# Altium project MelansonTech Isolated Current Sense Rev 2.PrjPcb
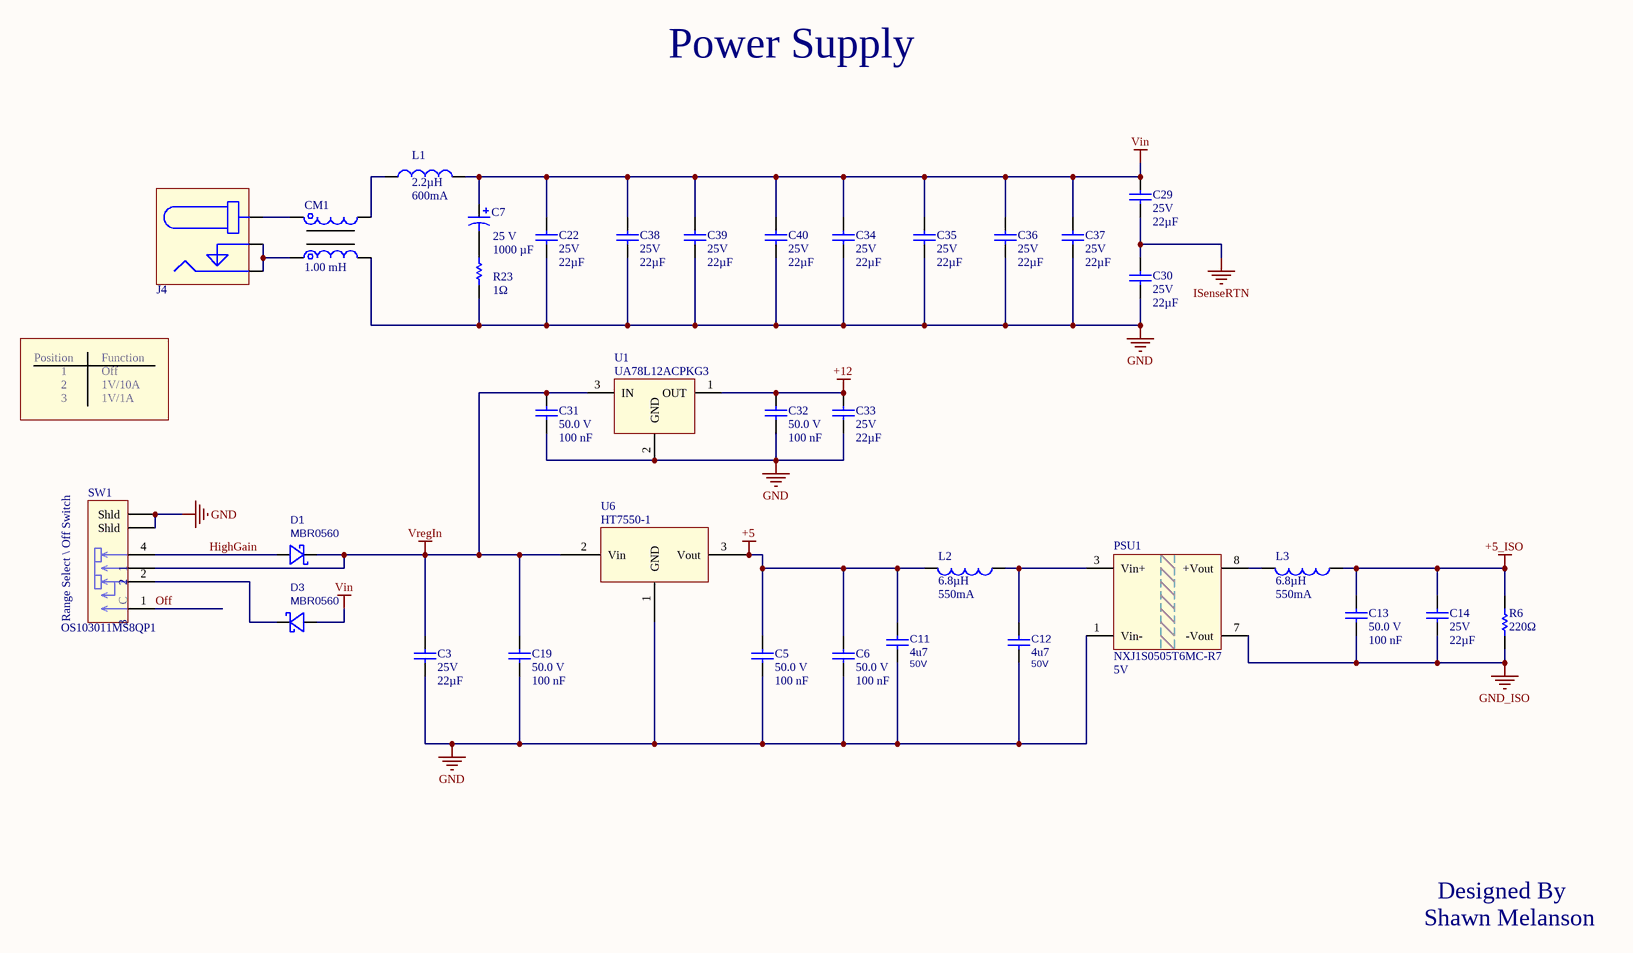
[diagram p0: MelansonTech PSU_IsolatedShuntAmp Rev2.SchDoc]
2 sheets, 95 parts. Net scope: global (net labels, ports and power ports of the same name join across sheets).
Sheets:
  MelansonTech PSU_IsolatedShuntAmp Rev2.SchDoc
  MelansonTech Isolated Shunt Amplifier rev 2 alt shunt.SchDoc

## Sheet MelansonTech PSU_IsolatedShuntAmp Rev2.SchDoc
size B

### Parts
C3  Voltage - Rated: 25V  Capacitance: 22µF  [Cap,0805]  (hidden comment: CL21A226MAQNNNE)
C5  Voltage Rating (DC): 50.0 V  Capacitance: 100 nF  [CAP, 0805, HD]  (hidden comment: CC0805KRX7R9BB104)
C6  Voltage Rating (DC): 50.0 V  Capacitance: 100 nF  [CAP, 0805, HD]  (hidden comment: CC0805KRX7R9BB104)
C7  Capacitance: 1000 µF  Voltage - Rated: 25 V  [Cap,5mm Lead Spaceing,14mm HIGH,10MM Dia, Polymer - RA1]  (hidden comment: A750MV108M1EAAE014)
C11  Capacitance: 4u7  Voltage: 50V  [Cap, 1206]  (hidden comment: CL31B475KBHNNNE)
C12  Capacitance: 4u7  Voltage: 50V  [Cap, 1206]  (hidden comment: CL31B475KBHNNNE)
C13  Voltage Rating (DC): 50.0 V  Capacitance: 100 nF  [Cap,0805]  (hidden comment: CC0805KRX7R9BB104)
C14  Voltage - Rated: 25V  Capacitance: 22µF  [Cap,0805]  (hidden comment: CL21A226MAQNNNE)
C19  Voltage Rating (DC): 50.0 V  Capacitance: 100 nF  [CAP, 0805, HD]  (hidden comment: CC0805KRX7R9BB104)
C22  Voltage - Rated: 25V  Capacitance: 22µF  [Cap,0805]  (hidden comment: CL21A226MAQNNNE)
C29  Voltage - Rated: 25V  Capacitance: 22µF  [Cap,0805]  (hidden comment: CL21A226MAQNNNE)
C30  Voltage - Rated: 25V  Capacitance: 22µF  [Cap,0805]  (hidden comment: CL21A226MAQNNNE)
C31  Voltage Rating (DC): 50.0 V  Capacitance: 100 nF  [CAP, 0805, HD]  (hidden comment: CC0805KRX7R9BB104)
C32  Voltage Rating (DC): 50.0 V  Capacitance: 100 nF  [CAP, 0805, HD]  (hidden comment: CC0805KRX7R9BB104)
C33  Voltage - Rated: 25V  Capacitance: 22µF  [Cap,0805]  (hidden comment: CL21A226MAQNNNE)
C34  Voltage - Rated: 25V  Capacitance: 22µF  [Cap,0805]  (hidden comment: CL21A226MAQNNNE)
C35  Voltage - Rated: 25V  Capacitance: 22µF  [Cap,0805]  (hidden comment: CL21A226MAQNNNE)
C36  Voltage - Rated: 25V  Capacitance: 22µF  [Cap,0805]  (hidden comment: CL21A226MAQNNNE)
C37  Voltage - Rated: 25V  Capacitance: 22µF  [Cap,0805]  (hidden comment: CL21A226MAQNNNE)
C38  Voltage - Rated: 25V  Capacitance: 22µF  [Cap,0805]  (hidden comment: CL21A226MAQNNNE)
C39  Voltage - Rated: 25V  Capacitance: 22µF  [Cap,0805]  (hidden comment: CL21A226MAQNNNE)
C40  Voltage - Rated: 25V  Capacitance: 22µF  [Cap,0805]  (hidden comment: CL21A226MAQNNNE)
CM1  Inductance: 1.00 mH  [CM Choke,SMD, DR331]  (hidden comment: DR331-105BE)
D1  MBR0560  [SOD123]
D3  MBR0560  [SOD123]
J4  PJ-002A  [Connector,Barrel,2.1mm,5.5mm,DC power Jack]  (value not drawn)
L1  Inductance: 2.2µH  Current Rating: 600mA  [Ind, 0805]  (hidden comment: MLZ2012M2R2HT000)
L2  Inductance: 6.8µH  Current Rating (Amps): 550mA  [Ind, 0805]  (hidden comment: MLZ2012N6R8LT000)
L3  Inductance: 6.8µH  Current Rating (Amps): 550mA  [Ind, 0805]  (hidden comment: MLZ2012N6R8LT000)
PSU1  Voltage - Output 1: 5V  [14-SMD Module, 6 Leads,NXJ1S0505T6MC-R7]  (hidden comment: NXJ1S0505T6MC-R7)
R6  Resistance: 220Ω  [Res,1206]  (hidden comment: RMCF1206FT220R)
R23  Resistance: 1Ω  [res, 0805, HD]  (hidden comment: Res1)
SW1  OS103011MS8QP1  [Switch,Slide,.SP3T, OS103011 -Side]
U1  UA78L12ACPKG3  [SOT89-3]
U6  HT7550-1  [SOT89-3]

### Nets
+5: C5.2 C6.2 C11.2 L2.2 U6.3(Vout)
+5_ISO: C13.2 C14.2 L3.1 R6.2
+12: C32.2 C33.2 U1.1(OUT)
GND: C3.1 C5.1 C6.1 C11.1 C12.1 C19.1 C22.1 C30.1 C31.1 C32.1 C33.1 C34.1 C35.1 C36.1 C37.1 C38.1 C39.1 C40.1 CM1.4 PSU1.1(Vin-) R23.1 SW1.5(Shld) SW1.6(Shld) U1.2(GND) U6.1(GND)
GND_ISO: C13.1 C14.1 PSU1.7(-Vout) R6.1
ISenseRTN: C29.1 C30.2
Vin: C7.1 C22.2 C29.2 C34.2 C35.2 C36.2 C37.2 C38.2 C39.2 C40.2 D3.2(A) L1.2
VregIn: C3.2 C19.2 C31.2 D1.1(C) SW1.3 U1.3(IN) U6.2(Vin)
HighGain: D1.2(A) SW1.4
Off: SW1.1
NetC7_2: C7.2 R23.2
NetC12_2: C12.2 L2.1 PSU1.3(Vin+)
NetCM1_1: CM1.1 J4.1
NetCM1_2: CM1.2 L1.1
NetCM1_3: CM1.3 J4.2 J4.3
NetD3_1: D3.1(C) SW1.2
NetL3_2: L3.2 PSU1.8(+Vout)

Not connected (* = marked no-connect by the designer): PSU1 12(NC) 14(NC)

### Notes on the sheet
- Power Supply
- Position
- 1
- 2
- Function
- Off
- 1V/10A
- 3
- 1V/1A
- Range Select \ Off Switch
- Shawn Melanson
- Designed By
- (in symbol Switch,TH,Slide,SP3T,100MA,12V,OS103011MS8QP1) C

### Library data of the parts
C3 C14 C22 C29 C30 C33-C40 = Cap,0805,22uF,25V,X5R,±20%,CL21A226MAQNNNE: CAP CER 22UF 25V X5R 0805; Manufacturer: Samsung Electro-Mechanics; Detailed Description: 22 µF ±20% 6.3V Ceramic Capacitor X5R 0805 (2012 Metric); Tolerance: ±20%; mfg P/N: CL21A226MAQNNNE; Category: Capacitors  Ceramic Capacitors; Series: CL; Part Status: Active; Temperature Coefficient: X5R; Operating Temperature: -55°C ~ 85°C; Applications: General Purpose; Mounting Type: Surface Mount, MLCC; Package / Case: 0805 (2012 Metric); Size / Dimension: 0.079" L x 0.049" W (2.00mm x 1.25mm); Thickness (Max): 0.055" (1.40mm); Supplier 1: Mouser; Supplier Part Number 1: 187-CL31B226KPHNNNE; Supplier 2: Digikey; Supplier Part Number 2: 1276-2769-6-ND; Supplier 3: Digikey; Supplier Part Number 3: 1276-2769-1-ND
C5 C6 C13 C19 C31 C32 = Cap,0805,100nf,50V,5%,CC0805KRX7R9BB104: CAP CER 0.1UF 50V X7R 0805; Manufacturer: YAGEO; Capacitance Tolerance: ±10%; Detailed Description: 0.1 µF ±10% 50V Ceramic Capacitor X7R 0805 (2012 Metric); Supplier 1: Digikey; Supplier Part Number 1: 311-1140-6-ND; Supplier 2: Digikey; Supplier Part Number 2: 311-1140-1-ND; Supplier 3: Mouser; Supplier Part Number 3: 603-CC805KRX7R9BB104; Supplier 4: Arrow Electronics; Supplier Part Number 4: CC0805KRX7R9BB104; Supplier 5: Digikey; Supplier Part Number 5: 311-1140-2-ND; Supplier 6: Future Electronics; Supplier Part Number 6: 2986263; Manufacturer Product Number: CC0805KRX7R9BB104; Category: Capacitors  Ceramic Capacitors; Series: CC; Part Status: Active; Temperature Coefficient: X7R; Operating Temperature: -55°C ~ 125°C; Applications: General Purpose; Mounting Type: Surface Mount, MLCC; Package / Case: 0805 (2012 Metric); Size / Dimension: 0.079" L x 0.049" W (2.00mm x 1.25mm); Thickness (Max): 0.033" (0.85mm)
C7 = Cap,Polar,TH,1000uF,25V,Polymer,±20%,A750MV108M1EAAE014: 1000 µF 25 V Aluminum - Polymer Capacitors Radial, Can 14mOhm 2000 Hrs @ 105°C; Manufacturer: KEMET; Tolerance: ±20%; Ripple Current @ Low Frequency: 255 mA @ 120 Hz; Ripple Current @ High Frequency: 5.1 A @ 100 kHz; Base Product Number: A750MV; mfg P/N: A750MV108M1EAAE014; Detailed Description: 1000 µF 25 V Aluminum - Polymer Capacitors Radial, Can 14mOhm 2000 Hrs @ 105°C; Category: Capacitors  Aluminum - Polymer Capacitors; Series: A750; Part Status: Active; Type: Polymer; ESR (Equivalent Series Resistance): 14mOhm; Lifetime @ Temp.: 2000 Hrs @ 105°C; Operating Temperature: -55°C ~ 105°C; Applications: General Purpose; Lead Spacing: 0.197" (5.00mm); Size / Dimension: 0.394" Dia (10.00mm); Height - Seated (Max): 0.630" (16.00mm); Mounting Type: Through Hole; Package / Case: Radial, Can; Supplier 1: Digi-Key; Supplier Part Number 1: 399-A750MV108M1EAAE014-ND; Supplier 2: Mouser; Supplier Part Number 2: 80-A750MV108M1EAAE14
C11 C12 = Cap,1206,4.7uF,10%,50V,CL31B475KBHNNNE: Cap,SMD,MLCC,4u7,50V,X7R,10%,1206; Manufacturer: Samsung; Manufacturer P/N: CL31B475KBHNNNE; Tolerance: 10%; Package: 1206; Supplier 1: LCSC; Supplier Part Number 1: C51205; Supplier 2: Digi-Key; Supplier Part Number 2: 1276-2789-1-ND; JLCPCB Part #: C29823
CM1 = common mode, 1mH@100kHz, 500mA, SMD,2ln, DR331-105BE: CMC 1MH 500MA 2LN SMD; Lead-Free Status: Lead Free; Detailed Description: 1 mH @ 100 kHz 2 Line Common Mode Choke Surface Mount 500mA DCR 400mOhm; Category  Filters: Common Mode Chokes; Filter Type: Signal Line; Number of Lines: 2; DC Resistance (DCR) (Max): 400mOhm; Voltage Rating - DC: 80V; Voltage Rating - AC: 42V; Base Product Number: DR331; mfg P/N: DR331-105BE; Mounting Style: SMD; Current Rating: 500mA; Series: DR331; Part Status: Active; Inductance @ Frequency: 1 mH @ 100 kHz; Operating Temperature: -40°C ~ 135°C; Mounting Type: Surface Mount; Size / Dimension: 0.287" L x 0.213" W (7.30mm x 5.40mm); Height (Max): 0.197" (5.00mm); Package / Case: Horizontal, 4 Flat Lead
D1 D3 = Diode,SOD123,Shottky,60V,0.5A,MBR0560: Dio,Sig,Schtky,0.5A,60V,SOD123; Manufacturer: MCC; mfg P/N: MBR0560-TP; Details: 700mV @ 500mA, 200µA @ 60V,30pF @ 4V, 1MHz; Not Stuffed: N/S; Fast Supplier: Digi-Key; Current: 0.5A; Package: SOD123; Voltage: 60V; Supplier 1: Digi-Key; Supplier Part Number 1: MBR0560TPMSCT-ND; Supplier 2: LCSC; Supplier Part Number 2: C150515; JLCPCB Part #: C77338
J4 = Connector,Barrel,ID 2.1mm,OD 5.5mm,Power Connect, PJ-002A: Power Barrel Connector Jack 2.10mm ID (0.083"), 5.50mm OD (0.217") Through Hole, Right Angle; Manufacturer: CUI Inc.; Actual Diameter: 0.079" (2.00mm ID), 0.256" (6.50mm OD); Number of Positions/Contacts: 2 Conductors, 3 Contacts; Mating Length/Depth: 0.354" (9.00mm); Dielectric Material: Polybutylene Terephthalate (PBT); Internal Switch(s): Does Not Contain Switch; Shielding: Unshielded; Voltage - Rated: 24VDC; Current Rating (Amps): 2.5A; Material Flammability Rating: UL94 V-0; Body Color: Black; mfg P\N: PJ-002A; Industry Recognized Mating Diameter: 2.10mm ID (0.083"), 5.50mm OD (0.217"); Connector Type: Jack; Mounting Type: Through Hole, Right Angle; Termination: Solder Eyelet(s); Contact Material - Plating: Tin; Operating Temperature: -25°C ~ 85°C; Contact Material: Brass, Copper Alloy; Supplier 1: Digi-Key; Supplier Part Number 1: CP-002A-ND
L1 = Ind. 0805,2.2uH,600mA,160mOhm, MLZ2012M2R2HT000: FIXED IND 2.2UH 600MA 160 MOHM; Manufacturer: TDK Corporation; Detailed Description: 2.2µH Shielded Multilayer Inductor 600mA 208 mOhm Max 0805 (2012 Metric); Type: Multilayer; Material - Core: Ferrite; Tolerance: ±20%; Current - Saturation: 400mA; Shielding: Shielded; DC Resistance (DCR): 208 mOhm Max; Frequency - Self Resonant: 100MHz; Inductance Frequency - Test: 2MHz; mfg P/N: MLZ2012M2R2HT000; Series: MLZ; Operating Temperature: -55°C ~ 125°C; Mounting Type: Surface Mount; Package / Case: 0805 (2012 Metric); Supplier 1: Digi-Key; Supplier Part Number 1: 445-8658-1-ND
L2 L3 = Ind,0805,6.8uH,550mA,0.25Ω, MLZ2012N6R8LT000: FIXED IND 6.8UH 550MA 250 MOHM; Manufacturer: TDK Corporation; Detailed Description: 6.8µH Shielded Multilayer Inductor 550mA 250mOhm 0805 (2012 Metric); Type: Multilayer; Material - Core: Ferrite; Tolerance: ±20%; Current - Saturation: 110mA; Shielding: Shielded; Frequency - Self Resonant: 60MHz; Inductance Frequency - Test: 2MHz; mfg P/N: MLZ2012N6R8LT000; Category: Inductors, Coils, Chokes  Fixed Inductors; Series: MLZ; Part Status: Active; DC Resistance (DCR): 250mOhm; Operating Temperature: -55°C ~ 125°C; Mounting Type: Surface Mount; Package / Case: 0805 (2012 Metric); Supplier Device Package: 0805 (2012 Metric); Size / Dimension: 0.079"" L x 0.049"" W (2.00mm x 1.25mm); Height - Seated (Max): 0.041"" (1.05mm); Supplier 1: Digi-Key; Supplier Part Number 1: 445-6761-1-ND; Supplier 2: LCSC; Supplier Part Number 2: C82157
PSU1 = Mod,PSU,Isolated,4.5-5Vin,5Vout,1W,4.2kVIso,200mA,NXJ1S0505T6MC-R7: Isolated Module DC DC Converter 1 Output 5V 200mA 4.5V - 5.5V Input; Manufacturer: Murata Power Solutions Inc.; Number of Outputs: 1; Power (Watts): 1 W; Voltage - Isolation: 4.2 kV; Efficiency: 76%; Approval Agency: cURus; Standard Number: 60601-1; 62368-1; Detailed Description: Isolated Module DC DC Converter 1 Output 5V 200mA 4.5V - 5.5V Input; Category: Power Supplies - Board Mount  DC DC Converters; Series: NXJ1T (1W); Part Status: Active; Type: Isolated Module; Voltage - Input (Min): 4.5V; Voltage - Input (Max): 5.5V; Current - Output (Max): 200mA; Applications: ITE (Commercial), Medical; Operating Temperature: -40°C ~ 125°C (With Derating); Mounting Type: Surface Mount; Package / Case: 14-SMD Module, 6 Leads; Size / Dimension: 0.54" L x 0.42" W x 0.16" H (13.7mm x 10.6mm x 4.0mm); Supplier 1: DigiKey; Supplier Part Number 1: 811-NXJ1S0505T6MC-R7CT-ND; mfg P/N: NXJ1S0505T6MC-R7
R6 = Res,1206,220Ω,±1%,±100ppm/°C,0.25W,RMCF1206FT220R: 220 Ohms ±1% 0.25W, 1/4W Chip Resistor 1206 (3216 Metric) Automotive AEC-Q200 Thick Film; Manufacturer: Stackpole Electronics IncStackpole Electronics Inc; mfg P/N: RMCF1206FT220R; Detailed Description: 220 Ohms ±1% 0.25W, 1/4W Chip Resistor 1206 (3216 Metric) Automotive AEC-Q200 Thick Film; Category: Resistors  Chip Resistor - Surface Mount; Series: RMCF; Part Status: Active; Tolerance: ±1%; Power (Watts): 0.25W, 1/4W; Composition: Thick Film; Features  Automotive: AEC-Q200; Temperature Coefficient: ±100ppm/°C; Operating Temperature: -55°C ~ 155°C; Package / Case: 1206 (3216 Metric); Supplier Device Package: 1206; Size / Dimension: 0.126" L x 0.063" W (3.20mm x 1.60mm); Height - Seated (Max): 0.028" (0.70mm); Number of Terminations: 2; Supplier 1: DigiKey; Supplier Part Number 1: RMCF1206FT220RCT-ND; JLCPCB Part #: C2484105
R23 = Res,0805,Generic: Tolerance: *; PPM: *; Wattage: *
SW1 = Switch,TH,Slide,SP3T,100MA,12V,OS103011MS8QP1: SWITCH SLIDE SP3T 100MA 12V; Manufacturer: C&K; Detailed Description: Slide Switch SP3T Through Hole; Switch Function: On-On-On; Current Rating (Amps): 100mA (DC); Actuator Type: Standard; Actuator Length: 4.00mm; Actuator Material: Polyoxymethylene (Acetal) (POM); Switch Travel: 2.00mm; Mechanical Life: 10,000 Cycles; mfg P/N: OS103011MS8QP1; Part Status: Active; Circuit: SP3T; Voltage Rating - DC: 12V; Contact Material: Copper Alloy; Contact Finish: Silver; Mounting Type: Through Hole; Termination Style: PC Pin; Features: Epoxy Sealed Terminals; Operating Temperature: -30°C ~ 70°C; Electrical Life: 10,000 Cycles; Supplier 1: Digi-Key; Supplier Part Number 1: CKN9543-ND; Supplier 2: LCSC; Supplier Part Number 2: C221831
U1 = Reg,Linear,Pos,Fixed,12Vout,27Vin,100mA,UA78L12ACPKG3: IC REG LINEAR 12V 100MA SOT89-3; Manufacturer: Texas Instruments; Detailed Description: Linear Voltage Regulator IC Positive Fixed 1 Output 100mA SOT-89-3; Output Configuration: Positive; Output Type: Fixed; Voltage - Input (Max): 27V; Voltage Dropout (Max): 1.7V @ 40mA; PSRR: 42dB (120Hz); Protection Features: Over Current, Over Temperature, Reverse Polarity, Short Circuit; Number of Regulators: 1; mfg P/N: UA78L12ACPKG3; Category: Integrated Circuits (ICs)  PMIC - Voltage Regulators - Linear; Part Status: Active; Voltage - Output (Min/Fixed): 12V; Current - Output: 100mA; Operating Temperature: 0°C ~ 125°C; Mounting Type: Surface Mount; Package / Case: TO-243AA; Supplier Device Package: SOT-89-3; Base Product Number: UA78L12; Supplier 1: Digi-Key; Supplier Part Number 1: 296-50454-6-ND; Supplier 2: Mouser; Supplier Part Number 2: 595-UA78L12ACPKG3; Supplier 3: Arrow Electronics; Supplier Part Number 3: UA78L12ACPKG3; JLCPCB Part #: C7372179
U6 = Reg,Linear,Fixed,SOT-89-3,30Vin,5Vout,150mA,HT7550-1: LOW DROPOUT REGULATORS(LDO) POSITIVE FIXED 55MV @ 1MA 30V 5V 150MA SOT-89(SOT-89-3) ROHS; Manufacturer: Holtek Semicon; Input Voltage (Max): 30Vdc; Output voltage accuracy: tolerance ±3%; Quiescent current: 2.5μA; Output Voltage: 5Vdc; LCSC Part #: C16106; Package: SOT-89-3; Output Current (Max): 150mA; mfg P/N: HT7550-1; JLCPCB Part #: C16106

## Sheet MelansonTech Isolated Shunt Amplifier rev 2 alt shunt.SchDoc
size C
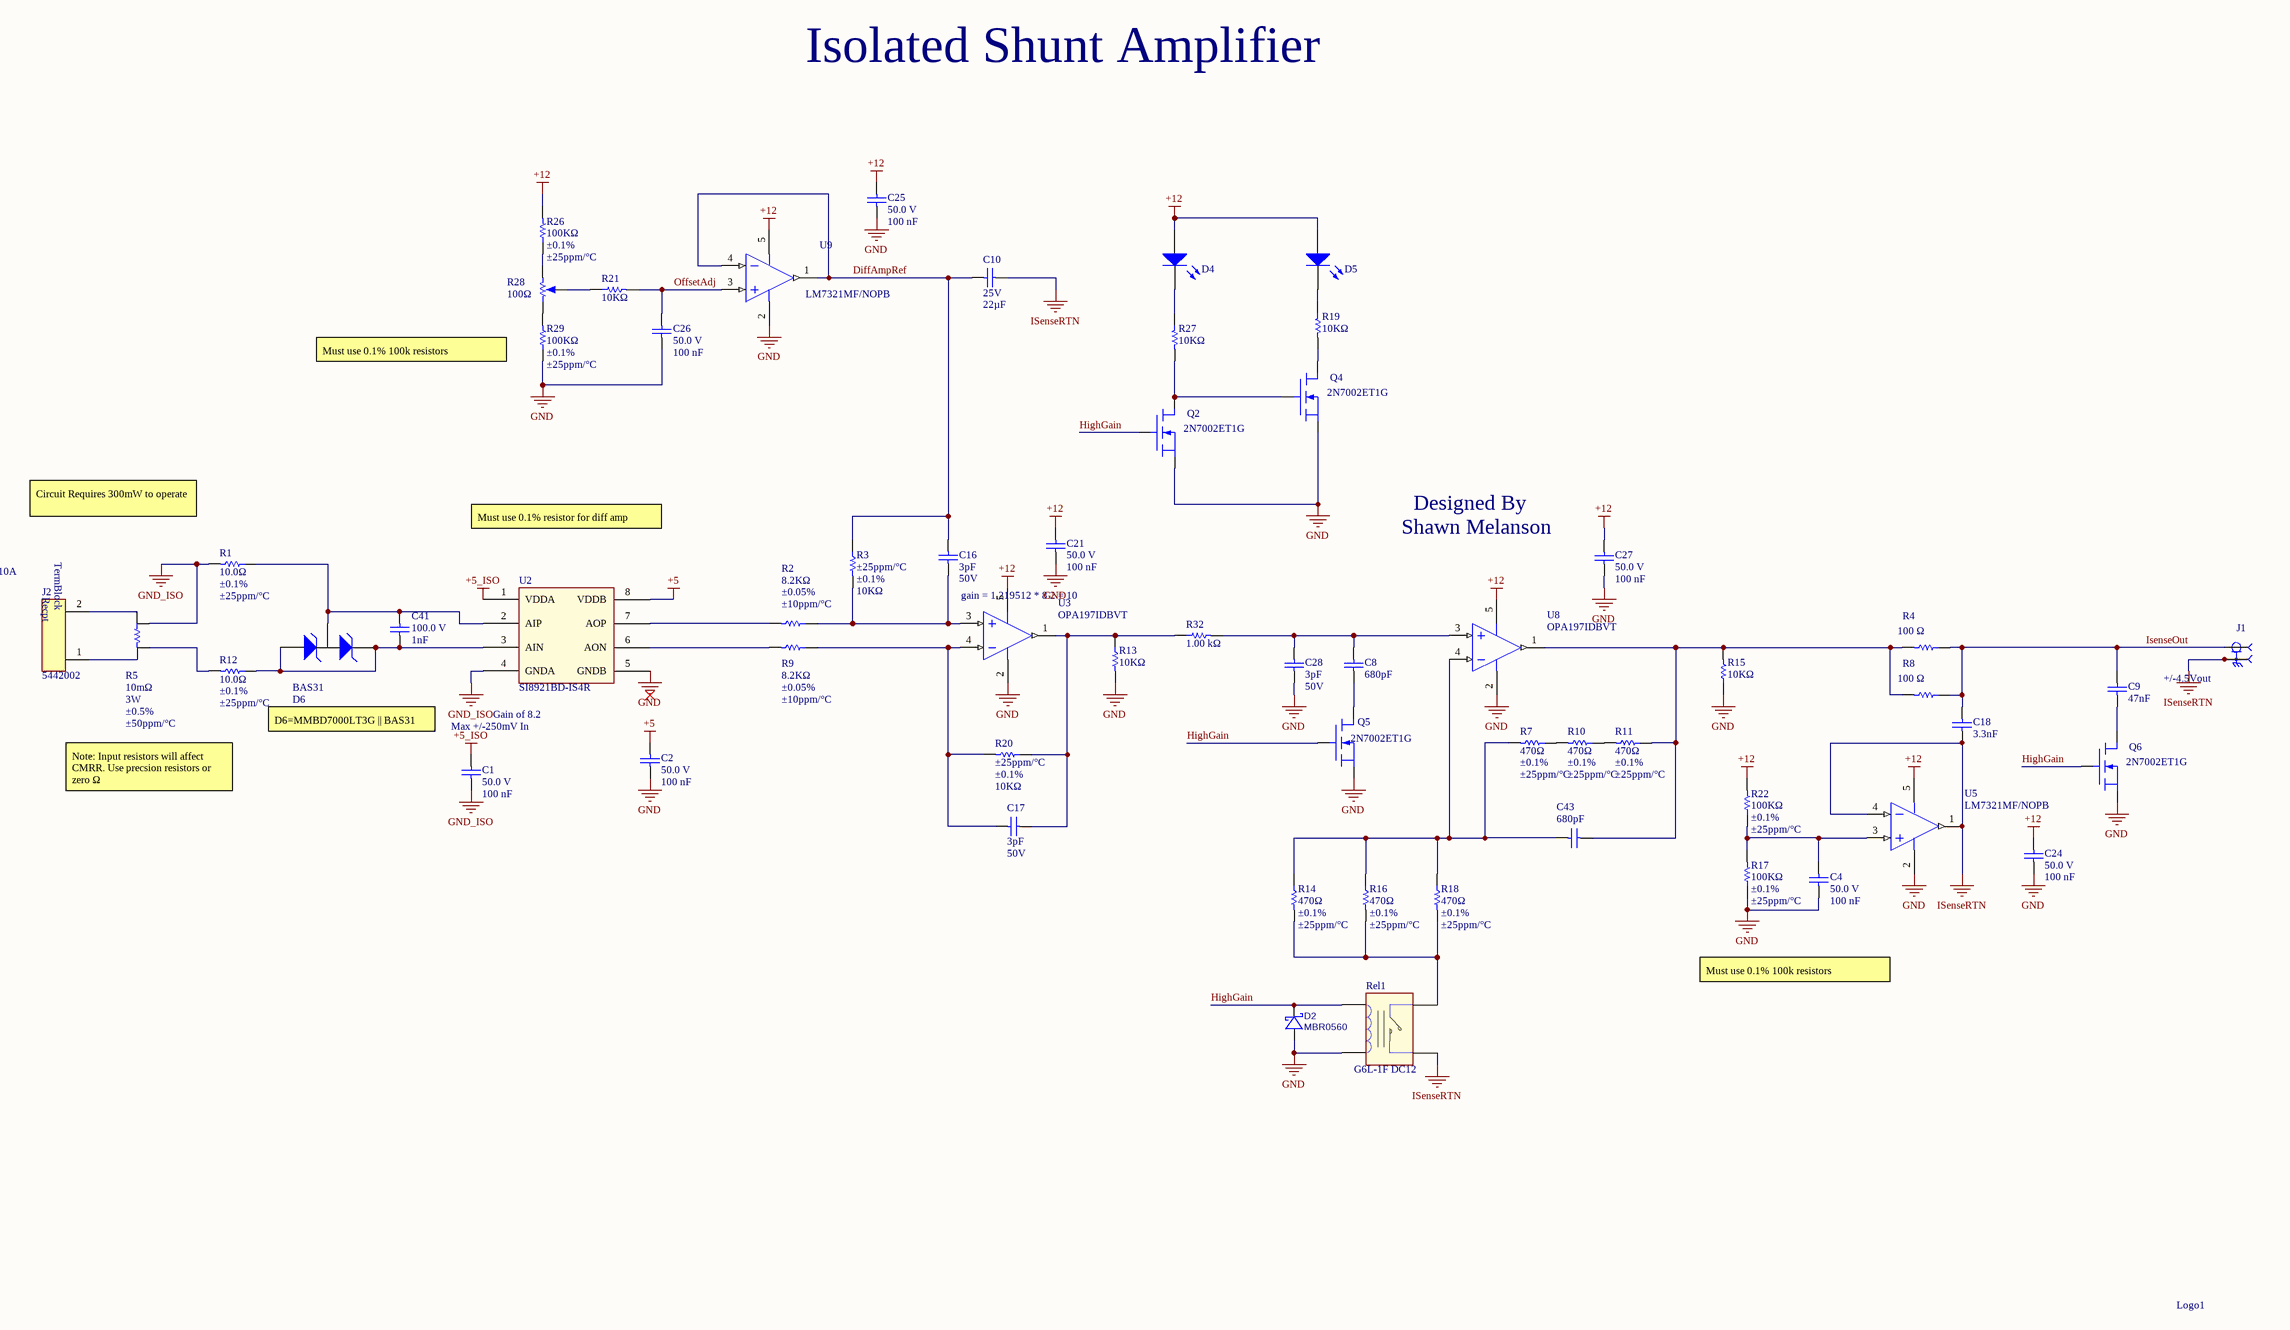
[diagram p1: MelansonTech Isolated Shunt Amplifier rev 2 alt shunt.SchDoc]

### Parts
C1  Voltage Rating (DC): 50.0 V  Capacitance: 100 nF  [CAP, 0805, HD]  (hidden comment: CC0805KRX7R9BB104)
C2  Voltage Rating (DC): 50.0 V  Capacitance: 100 nF  [CAP, 0805, HD]  (hidden comment: CC0805KRX7R9BB104)
C4  Voltage Rating (DC): 50.0 V  Capacitance: 100 nF  [CAP, 0805, HD]  (hidden comment: CC0805KRX7R9BB104)
C8  Cap: 680pF  [CAP, 0805, HD]  (hidden comment: Cap)
C9  Capacitance: 47nF  [CAP, 0805, HD]  (hidden comment: CL21B473KCFNNNE)
C10  Voltage - Rated: 25V  Capacitance: 22µF  [Cap,0805]  (hidden comment: CL21A226MAYNNNE)
C16  Capacitance: 3pF  Voltage - Rated: 50V  [CAP, 0805, HD]  (hidden comment: CC0805CRNPO9BN3R0)
C17  Capacitance: 3pF  Voltage - Rated: 50V  [CAP, 0805, HD]  (hidden comment: CC0805CRNPO9BN3R0)
C18  Capacitance: 3.3nF  [CAP, 0805, HD]  (hidden comment: CC0805KPX7R9BB332)
C21  Voltage Rating (DC): 50.0 V  Capacitance: 100 nF  [CAP, 0805, HD]  (hidden comment: CC0805KRX7R9BB104)
C24  Voltage Rating (DC): 50.0 V  Capacitance: 100 nF  [CAP, 0805, HD]  (hidden comment: CC0805KRX7R9BB104)
C25  Voltage Rating (DC): 50.0 V  Capacitance: 100 nF  [CAP, 0805, HD]  (hidden comment: CC0805KRX7R9BB104)
C26  Voltage Rating (DC): 50.0 V  Capacitance: 100 nF  [CAP, 0805, HD]  (hidden comment: CC0805KRX7R9BB104)
C27  Voltage Rating (DC): 50.0 V  Capacitance: 100 nF  [CAP, 0805, HD]  (hidden comment: CC0805KRX7R9BB104)
C28  Capacitance: 3pF  Voltage - Rated: 50V  [CAP, 0805, HD]  (hidden comment: CC0805CRNPO9BN3R0)
C41  Voltage Rating (DC): 100.0 V  Capacitance: 1nF  [CAP, 0805, HD]  (hidden comment: C0805X102J1GACAUTO)
C43  Cap: 680pF  [CAP, 0805, HD]  (hidden comment: Cap)
D2  MBR0560  [SOD123]
D4  OVLBB4C7  [LED,TH,T1,3MM-Vert]  (value not drawn)
D5  OVLBB4C7  [LED,TH,T1,3MM-Vert]  (value not drawn)
D6  BAS31  [SOT23-3]
J1  142-0701-801  [CINCH_142-0701-801]  (value not drawn)
J2  5442002  [TERM BLOCK HDR 2POS 5.08MM,5442002]
Logo1  Open Source Logo  [Symbol,Open Source - No Text]  (value not drawn)
Q2  2N7002ET1G  [SOT23-3]
Q4  2N7002ET1G  [SOT23-3]
Q5  2N7002ET1G  [SOT23-3]
Q6  2N7002ET1G  [SOT23-3]
R1  Resistance: 10.0Ω  Tolerance: ±0.1%  Temperature Coefficient: ±25ppm/°C  [res, 0805, HD]  (hidden comment: RNCS0805BKE10R0)
R2  Resistance: 8.2KΩ  Tolerance: ±0.05%  Temperature Coefficient: ±10ppm/°C  [res, 0805, HD]  (hidden comment: ERA-6VRW8201V)
R3  Temperature Coefficient: ±25ppm/°C  Resistance Tolerance: ±0.1%  Resistance: 10KΩ  [res, 0805, HD]  (hidden comment: RG2012P-103-B-T5)
R4  Resistance: 100 Ω  [res, 0805, HD]  (hidden comment: CRCW0805100RJNEAC)
R5  Power (Watts): 3W  Temperature Coefficient: ±50ppm/°C  Resistance: 10mΩ  Tolerance: ±0.5%  [Res,SMD,3637, Nonstandard,4Term]  (hidden comment: WSL3637R0100DEA)
R7  Resistance: 470Ω  Tolerance: ±0.1%  Temperature Coefficient: ±25ppm/°C  [res, 0805, HD]  (hidden comment: ERA-6AEB471V)
R8  Resistance: 100 Ω  [res, 0805, HD]  (hidden comment: CRCW0805100RJNEAC)
R9  Resistance: 8.2KΩ  Tolerance: ±0.05%  Temperature Coefficient: ±10ppm/°C  [res, 0805, HD]  (hidden comment: ERA-6VRW8201V)
R10  Resistance: 470Ω  Tolerance: ±0.1%  Temperature Coefficient: ±25ppm/°C  [res, 0805, HD]  (hidden comment: ERA-6AEB471V)
R11  Resistance: 470Ω  Tolerance: ±0.1%  Temperature Coefficient: ±25ppm/°C  [res, 0805, HD]  (hidden comment: ERA-6AEB471V)
R12  Resistance: 10.0Ω  Tolerance: ±0.1%  Temperature Coefficient: ±25ppm/°C  [res, 0805, HD]  (hidden comment: RNCS0805BKE10R0)
R13  Resistance: 10KΩ  [res, 0805, HD]  (hidden comment: CRCW080510K0FKTA)
R14  Resistance: 470Ω  Tolerance: ±0.1%  Temperature Coefficient: ±25ppm/°C  [res, 0805, HD]  (hidden comment: ERA-6AEB471V)
R15  Resistance: 10KΩ  [res, 0805, HD]  (hidden comment: CRCW080510K0FKTA)
R16  Resistance: 470Ω  Tolerance: ±0.1%  Temperature Coefficient: ±25ppm/°C  [res, 0805, HD]  (hidden comment: ERA-6AEB471V)
R17  Resistance: 100KΩ  Tolerance: ±0.1%  Temperature Coefficient: ±25ppm/°C  [res, 0805, HD]  (hidden comment: ERA-6AEB104V)
R18  Resistance: 470Ω  Tolerance: ±0.1%  Temperature Coefficient: ±25ppm/°C  [res, 0805, HD]  (hidden comment: ERA-6AEB471V)
R19  Resistance: 10KΩ  [res, 0805, HD]  (hidden comment: CRCW080510K0FKTA)
R20  Temperature Coefficient: ±25ppm/°C  Resistance Tolerance: ±0.1%  Resistance: 10KΩ  [res, 0805, HD]  (hidden comment: RG2012P-103-B-T5)
R21  Resistance: 10KΩ  [res, 0805, HD]  (hidden comment: CRCW080510K0FKTA)
R22  Resistance: 100KΩ  Tolerance: ±0.1%  Temperature Coefficient: ±25ppm/°C  [res, 0805, HD]  (hidden comment: ERA-6AEB104V)
R26  Resistance: 100KΩ  Tolerance: ±0.1%  Temperature Coefficient: ±25ppm/°C  [res, 0805, HD]  (hidden comment: ERA-6AEB104V)
R27  Resistance: 10KΩ  [res, 0805, HD]  (hidden comment: CRCW080510K0FKTA)
R28  Resistance: 100Ω  [Res,TH,POT,TopAdj]  (hidden comment: CT94EW103)
R29  Resistance: 100KΩ  Tolerance: ±0.1%  Temperature Coefficient: ±25ppm/°C  [res, 0805, HD]  (hidden comment: ERA-6AEB104V)
R32  Resistance: 1.00 kΩ  [res, 0805, HD]  (hidden comment: Vishay CRCW08051K00JNEA)
Rel1  G6L-1F DC12  [Relay,SMD,G6L-1F 12DC]
U2  SI8921BD-IS4R  [SOIC-8 DWV]
U3  OPA197IDBVT  [SOT23-5]
U5  LM7321MF/NOPB  [SOT23-5]
U8  OPA197IDBVT  [SOT23-5]
U9  LM7321MF/NOPB  [SOT23-5]

### Nets
+5: C2.2 U2.8(VDDB)
+5_ISO: C1.2 U2.1(VDDA)
+12: C21.2 C24.2 C25.2 C27.2 D4.1(A) D5.1(A) R22.2 R26.2 U3.5(V+) U5.5(V+) U8.5(V+) U9.5(V+)
GND: C2.1 C4.1 C21.1 C24.1 C25.1 C26.1 C27.1 C28.2 D2.2(A) Q2.2(S) Q4.2(S) Q5.2(S) Q6.2(S) R13.2 R15.1 R17.1 R29.1 Rel1.8 U2.5(GNDB) U3.2(V-) U5.2(V-) U8.2(V-) U9.2(V-)
GND_ISO: C1.1 R1.2 R5.4 U2.4(GNDA)
ISenseRTN: C10.1 C18.1 J1.S1 J1.S2 J1.S3 J1.S4 Rel1.4 U5.1(OUT) U5.4(IN-)
DiffAmpRef: C10.2 C16.2 R3.1 U9.1(OUT) U9.4(IN-)
HighGain: D2.1(C) Q2.1(G) Q5.1(G) Q6.1(G) Rel1.5
IsenseOut: C9.2 C18.2 J1.1 R4.1 R8.1
OffsetAdj: C26.2 R21.2 U9.3(IN+)
NetC4_2: C4.2 R17.2 R22.1 U5.3(IN+)
NetC8_1: C8.1 Q5.3(D)
NetC8_2: C8.2 C28.1 R32.2 U8.3(1IN+)
NetC9_1: C9.1 Q6.3(D)
NetC16_1: C16.1 R2.1 R3.2 U3.3(1IN+)
NetC17_1: C17.1 R9.1 R20.2 U3.4(1IN-)
NetC17_2: C17.2 R13.1 R20.1 R32.1 U3.1(1OUT)
NetC41_1: C41.1 D6.1(A) D6.2(K) R12.1 U2.3(AIN)
NetC41_2: C41.2 D6.3(AK) R1.1 U2.2(AIP)
NetC43_1: C43.1 R4.2 R8.2 R11.1 R15.2 U8.1(1OUT)
NetC43_2: C43.2 R7.2 R14.1 R16.1 R18.1 U8.4(1IN-)
NetD4_2: D4.2(K) R27.1
NetD5_2: D5.2(K) R19.1
NetJ2_1: J2.1 R5.2
NetJ2_2: J2.2 R5.1
NetQ2_3: Q2.3(D) Q4.1(G) R27.2
NetQ4_3: Q4.3(D) R19.2
NetR2_2: R2.2 U2.7(AOP)
NetR5_3: R5.3 R12.2
NetR7_1: R7.1 R10.2
NetR9_2: R9.2 U2.6(AON)
NetR10_1: R10.1 R11.2
NetR14_2: R14.2 R16.2 R18.2 Rel1.2
NetR21_1: R21.1 R28.2
NetR26_1: R26.1 R28.3
NetR28_1: R28.1 R29.2

### Notes on the sheet
- Isolated Shunt Amplifier
- Must use 0.1% 100k resistors
- Circuit Requires 300mW to operate
- Must use 0.1% resistor for diff amp
- Shawn Melanson
- Designed By
- 10A
- gain = 1.219512 * 8.2 = 10
- (near J1) +/-4.5Vout
- D6=MMBD7000LT3G || BAS31
- Max +/-250mV In
- (near U2) Gain of 8.2
- Note: Input resistors will affect CMRR. Use precsion resistors or zero Ω
- (in symbol TermBlock,Header,Male,RA,TH,12A,400V,5.08mmPitch,5442002) TermBlock; Recpt

### Library data of the parts
C1 C2 C4 C21 C24-C27 = Cap,0805,100nf,50V,5%,CC0805KRX7R9BB104: as C5 on sheet MelansonTech PSU_IsolatedShuntAmp Rev2; Supplier 1: Digikey; Supplier Part Number 1: 311-1140-6-ND; Supplier 2: Digikey; Supplier Part Number 2: 311-1140-1-ND; Supplier 3: Mouser; Supplier Part Number 3: 603-CC805KRX7R9BB104; Supplier 4: Arrow Electronics; Supplier Part Number 4: CC0805KRX7R9BB104; Supplier 5: Digikey; Supplier Part Number 5: 311-1140-2-ND; Supplier 6: Future Electronics; Supplier Part Number 6: 2986263; Manufacturer Product Number: CC0805KRX7R9BB104; Category: Capacitors  Ceramic Capacitors; Series: CC; Part Status: Active; Temperature Coefficient: X7R; Operating Temperature: -55°C ~ 125°C; Applications: General Purpose; Mounting Type: Surface Mount, MLCC; Package / Case: 0805 (2012 Metric); Size / Dimension: 0.079" L x 0.049" W (2.00mm x 1.25mm); Thickness (Max): 0.033" (0.85mm)
C8 C43 = CAP,0805,Generic
C9 = Cap,0805,47nF,100V,±10%,CL21B473KCFNNNE: CAP CER 0.047UF 100V X7R 0805; Manufacturer: Samsung Electro-Mechanics; Detailed Description: 0.047 µF ±10% 100V Ceramic Capacitor X7R 0805 (2012 Metric); Tolerance: ±10%; mfg P/N: CL21B473KCFNNNE; Category: Capacitors  Ceramic Capacitors; Series: CL; Part Status: Active; Voltage - Rated: 100V; Temperature Coefficient: X7R; Operating Temperature: -55°C ~ 125°C; Applications: General Purpose; Mounting Type: Surface Mount, MLCC; Package / Case: 0805 (2012 Metric); Size / Dimension: 0.079" L x 0.049" W (2.00mm x 1.25mm); Thickness (Max): 0.053" (1.35mm); Supplier 1: Digikey; Supplier Part Number 1: 1276-2960-1-ND; JLCPCB Part #: C53134
C10 = Cap,0805,22uF,25V,X5R,±20%,CL21A226MQQNNNE: CAP CER 22UF 25V X5R 0805; Manufacturer: Samsung Electro-Mechanics; Detailed Description: 22 µF ±20% 25V Ceramic Capacitor X5R 0805 (2012 Metric); Tolerance: ±20%; mfg P/N: CL21A226MAYNNNE; Category: Capacitors  Ceramic Capacitors; Series: CL; Part Status: Active; Temperature Coefficient: X5R; Operating Temperature: -55°C ~ 85°C; Applications: General Purpose; Mounting Type: Surface Mount, MLCC; Package / Case: 0805 (2012 Metric); Size / Dimension: 0.079" L x 0.049" W (2.00mm x 1.25mm); Thickness (Max): 0.055" (1.40mm); JLCPCB Part #: C45783; Supplier 1: DigiKey; Supplier Part Number 1: 1276-CL21A226MAYNNNECT-ND
C16 C17 C28 = CAP,0805,3pF,COG,NPO,CC0805CRNPO9BN3R0: CAP CER 3PF 50V C0G/NPO 0805; Manufacturer: YAGEO; Detailed Description: 3 pF ±0.25pF 50V Ceramic Capacitor C0G, NP0 0805 (2012 Metric); Tolerance: ±0.25pF; Temperature Coefficient: C0G, NP0; mfg P/N: CC0805CRNPO9BN3R0; Category: Capacitors  Ceramic Capacitors; Series: CC; Part Status: Active; Operating Temperature: -55°C ~ 125°C; Applications: General Purpose; Mounting Type: Surface Mount, MLCC; Package / Case: 0805 (2012 Metric); Size / Dimension: 0.079" L x 0.049" W (2.00mm x 1.25mm); Thickness (Max): 0.024" (0.60mm); Supplier 1: Future Electronics; Supplier Part Number 1: 9724337; Supplier 2: Arrow Electronics; Supplier Part Number 2: CC0805CRNPO9BN3R0; Supplier 3: Digikey; Supplier Part Number 3: 311-1092-1-ND; Supplier 4: Digikey; Supplier Part Number 4: 311-1092-6-ND; Supplier 5: Digikey; Supplier Part Number 5: 311-1092-2-ND; Supplier 6: Mouser; Supplier Part Number 6: 603-CC805CRNPO9BN3R0; JLCPCB Part #: C519937
C18 = Cap,0805,3.3nF,50V,±10%,CC0805KPX7R9BB332: CAP CER 3300PF 50V X7R 0805; Manufacturer: YAGEO; Detailed Description: 3300 pF ±10% 50V Ceramic Capacitor X7R 0805 (2012 Metric); Tolerance: ±10%; mfg P/N: CC0805KPX7R9BB332; Category: Capacitors  Ceramic Capacitors; Mfr: YAGEO; Series: CC; Part Status: Active; Voltage - Rated: 50V; Temperature Coefficient: X7R; Operating Temperature: -55°C ~ 125°C; Applications: General Purpose; Mounting Type: Surface Mount, MLCC; Package / Case: 0805 (2012 Metric); Size / Dimension: 0.079" L x 0.049" W (2.00mm x 1.25mm); Thickness (Max): 0.028" (0.70mm); Supplier 1: Digikey; Supplier Part Number 1: 13-CC0805KPX7R9BB332CT-ND; JLCPCB Part #: C1738
C41 = Cap,0805,1nF,±5%,100Vdc,CL10F104ZB8NNNC: CAPACITOR, 1NF, 100V, NP0, 0805; Capacitance Tolerance: ±5%; Dielectric Characteristic: C0G/NP0; Dielectric Material: Ceramic; Lead-Free Status: Lead Free; Case/Package: 0805; Mounting Style: Surface Mount; Octopart Url: https://octopart.com/c0805x102j1gacauto-kemet-23280135; Packaging: Cut Tape (CT); REACH SVHC Compliance: No SVHC; RoHS: Compliant; mfg P/N: C0805X102J1GACAUTO; Supplier 1: Digi-Key; Supplier Part Number 1: 399-19430-1-ND; Supplier 2: Digikey; Supplier Part Number 2: 399-19430-1-ND; JLCPCB Part #: C46653
D2 = Diode,SOD123,Shottky,60V,0.5A,MBR0560: as D1 on sheet MelansonTech PSU_IsolatedShuntAmp Rev2; Fast Supplier: Digi-Key; Current: 0.5A; Package: SOD123; Voltage: 60V; Supplier 1: Digi-Key; Supplier Part Number 1: MBR0560TPMSCT-ND; Supplier 2: LCSC; Supplier Part Number 2: C150515; JLCPCB Part #: C77338
D4 D5 = LED,TH,T1,3mm,Blue,OVLBB4C7: Blue 470nm LED Indication - Discrete 3.2V Radial; Mfg: TT Electronics/Optek Technology; Product Status: Active; Configuration: Standard; Lens Color: Colorless; Lens Transparency: Clear; Millicandela Rating: 1800mcd; Lens Style: Round with Domed Top; Lens Size: 3mm, T-1; Current - Test: 20mA; Viewing Angle: 45°; Base Product Number: OVLBB4; Category: Optoelectronics  LED Indication - Discrete; Color: Blue; Voltage - Forward (Vf) (Typ): 3.2V; Mounting Type: Through Hole; Wavelength - Dominant: 470nm; Package / Case: Radial; Supplier Device Package: 3mm; Height (Max): 5.35mm
D6 = Diode,Standard,Array,Series,120V,200mA,BAS31: Diode Array 1 Pair Series Connection 120 V 200mA Surface Mount TO-236-3, SC-59, SOT-23-3; Manufacturer: onsemi; Voltage - DC Reverse (Vr) (Max): 120 V; Voltage - Forward (Vf) (Max) @ If: 1.25 V @ 400 mA; Speed: Small Signal =< 200mA (Io), Any Speed; Reverse Recovery Time (trr): 50 ns; Current - Reverse Leakage @ Vr: 100 nA @ 90 V; Detailed Description: Diode Array 1 Pair Series Connection 120 V 200mA Surface Mount TO-236-3, SC-59, SOT-23-3; mfg P/N: BAS31; Diode Type: Standard; Diode Configuration: 1 Pair Series Connection; Current - Average Rectified (Io) (per Diode): 200mA; Operating Temperature - Junction: 150°C (Max); Mounting Type: Surface Mount; Package / Case: TO-236-3, SC-59, SOT-23-3; Base Part Number: BAS31; Supplier 1: DigiKey; Supplier Part Number 1: BAS31FSDKR-ND; JLCPCB Part #: C415998
J1 = Conn,SMA,Female,End Launch,142-0701-801: CONN SMA JACK STR 50OHM EDGE MNT; Manufacturer: Cinch Connectivity Solutions Johnson; Detailed Description: SMA Connector Jack, Female Socket 50Ohm Board Edge, End Launch Solder; Connector: Style   SMA; Connector Type: Jack, Female Socket; Contact Termination: Solder; Body Material: Brass; Body Finish: Gold; Dielectric Material: Polytetrafluoroethylene (PTFE); Center Contact Material: Beryllium Copper; Mating Cycles: 500; Number of Ports: 1; Frequency - Max: 18GHz; Voltage Rating: 335V; mfg P/N: 142-0701-801; Category: Connectors, Interconnects  Coaxial Connectors (RF); Part Status: Active; Shield Termination: Solder; Impedance: 50Ohm; Mounting Type: Board Edge, End Launch; Fastening Type: Threaded; Housing Color: Gold; Center Contact Plating: Gold; Operating Temperature: -65°C ~ 165°C; Supplier 1: Digi-Key; Supplier Part Number 1: J502-ND
J2 = TermBlock,Header,Male,RA,TH,12A,400V,5.08mmPitch,5442002: TERM BLOCK HDR 2POS 5.08MM; Manufacturer: Phoenix Contact; Number of Positions: 2; Number of Levels: 1; Pitch: 0.200" (5.08mm); Header Orientation: 90°, Right Angle; Current - IEC: 12A; Voltage - IEC: 400 V; Material Flammability Rating: UL94 V-0; Contact Tail Length: 0.138" (3.50mm); Mating Connect P/N: 5441980; mfg P/N: 5442002; Category: Connectors, Interconnects  Terminal Blocks  Headers, Plugs and Sockets; Series: BCH; Part Status: Active; Type: Header, Male Pins, Shrouded (4 Side); Positions Per Level: 2; Termination: Style  Solder; Mounting Type: Through Hole; Color: Green; Housing Material: Polyamide (PA), Nylon; Insulation Height: 0.339" (8.61mm); Supplier 1: Allied; Supplier Part Number 1: 71064909
Logo1 = Symbol,Open Source: Open Source Silk Screen Logo
Q2 Q4-Q6 = MOSFET,N-Channel,SOT23,0.25A,60V,2N7002ET1G: Small Signal MOSFET, 60 V, 310 mA, Single, N-Channel, 3-Pin SOT-23, Pb-Free, Tape and Reel; Manufacturer: ON Semiconductor; Continuous Drain Current (Ids): 0.25A; Lead-Free Status: Lead Free; Drain to Source Voltage (Vds): 60.0 V; Power Dissipation (Max): 350mW (Ta); REACH SVHC Compliance: No SVHC; Number of Pins: 3; Halogen Free Status: Halogen Free; Case/Package: SOT-23-3; Polarity: N-Channel; RoHS: Compliant; Lifecycle Status: Active; Supplier 1: Digi-Key; Supplier Part Number 1: 2N7002ET1GOSCT-ND; Supplier 2: LCSC; Supplier Part Number 2: C71533; Manufacturer Part Number: 2N7002ET1G; JLCPCB Part #: C71533
R1 R12 = Res,0805,10.0Ω,0.1%,±25ppm/°C,0.1W,RNCS0805BKE10R0: RES 10 OHM 0.1% 1/10W 0805; Manufacturer: Stackpole Electronics Inc; Detailed Description: 10 Ohms ±0.1% 0.1W, 1/10W Chip Resistor 0805 (2012 Metric) Anti-Corrosive, Automotive AEC-Q200, Moisture Resistant Thin Film; Power (Watts): 0.1W, 1/10W; Category: Resistors  Chip Resistor - Surface Mount; Series: RNCS; Part Status: Active; Composition: Thin Film; Features: Anti-Corrosive, Automotive AEC-Q200, Moisture Resistant; Operating Temperature: -55°C ~ 155°C; Package / Case: 0805 (2012 Metric); Supplier Device Package: 0805; Ratings: AEC-Q200; Size / Dimension: 0.079" L x 0.049" W (2.00mm x 1.25mm); Height - Seated (Max): 0.026" (0.65mm); Number of Terminations: 2; JLCPCB Part #: C346661
R2 R9 = Res,0805,8.2KΩ,±0.05%,±10ppm/°C,ERA-6VRW8201V: 8.2 kOhms ±0.05% 0.25W, 1/4W Chip Resistor 0805 (2012 Metric) Anti-Sulfur, Automotive AEC-Q200 Thin Film; Manufacturer: Panasonic Electronic Components; mfg P/N: ERA-6VRW8201V; Detailed Description: 8.2 kOhms ±0.05% 0.25W, 1/4W Chip Resistor 0805 (2012 Metric) Anti-Sulfur, Automotive AEC-Q200 Thin Film; Supplier 1: DigiKey; Supplier Part Number 1: 10-ERA-6VRW8201VCT-ND; Category: Resistors  Chip Resistor - Surface Mount; Series: ERA-6V; Part Status: Active; Power (Watts): 0.25W, 1/4W; Composition: Thin Film; Features: Anti-Sulfur, Automotive AEC-Q200; Operating Temperature: -55°C ~ 155°C; Package / Case: 0805 (2012 Metric); Supplier Device Package: 0805; Size / Dimension: 0.079" L x 0.049" W (2.00mm x 1.25mm); Height - Seated (Max): 0.026" (0.65mm); Number of Terminations: 2; Base Product Number: ERA-6VRW; JLCPCB Part #: C543754
R3 R20 = Res,0805,10.0kΩ,0.1%,±25ppm/°C,RG2012P-103-B-T5: RES SMD 10K OHM 0.1% 1/8W 0805; Mfr: Susumu; Lead-Free Status: Contains Lead; Voltage Rating (DC): 150.0 V; Detailed Description: 10 kOhms ±0.1% 0.125W, 1/8W Chip Resistor 0805 (2012 Metric) Anti-Sulfur, Automotive AEC-Q200 Thin Film; Power (Watts): 0.125W, 1/8W; Number of Pins: 2; Mounting Style: Surface Mount; mfg P/N: RG2012P-103-B-T5; Category: Resistors  Chip Resistor - Surface Mount; Series: RG; Part Status: Active; Features: Anti-Sulfur, Automotive AEC-Q200; Operating Temperature: -55°C ~ 155°C; Package / Case: 0805 (2012 Metric); Supplier Device Package: 0805; Ratings: AEC-Q200; Size / Dimension: 0.079" L x 0.049" W (2.00mm x 1.25mm); Height - Seated (Max): 0.020" (0.50mm); Number of Terminations: 2; Supplier 1: Future Electronics; Supplier Part Number 1: 4000243; Supplier 2: Mouser; Supplier Part Number 2: 754-RG2012P-103-B-T5; Supplier 3: Digikey; Supplier Part Number 3: RG20P10.0KBCT-ND; Supplier 4: Digikey; Supplier Part Number 4: RG20P10.0KBDKR-ND; Supplier 5: Digikey; Supplier Part Number 5: RG20P10.0KBTR-ND; JLCPCB Part #: C328719
R4 R8 = Res,0805,100Ω,5%,±200ppm/°C: RES 100 OHM 5% 1/8W 0805; Lead-Free Status: Lead Free; Power Rating: 0.125 W; Detailed Description: 100 Ohms ±5% 0.125W, 1/8W Chip Resistor 0805 (2012 Metric) Thick Film; Case/Package: 0805 (2012 Metric); Number of Pins: 2; RoHS: Compliant; mfg P/N: CRCW0805100RJNEAC; Tolerance: ±5%; Temperature Coefficient: ±200ppm/°C; Operating Temperature: -55°C ~ 155°C; Supplier 1: Digi-Key; Supplier Part Number 1: 541-100ACT-ND; JLCPCB Part #: C17408
R5 = Res,3637,10mΩ,3W,±0.5%,±50ppm/°C,WSL3637R0100DEA: 10 mOhms ±0.5% 3W Chip Resistor Nonstandard Anti-Sulfur, Automotive AEC-Q200, Current Sense, Moisture Resistant, Pulse Withstanding Metal Element; Manufacturer: Vishay Dale; mfg P/N: WSL3637R0100DEA; Detailed Description: 10 mOhms ±0.5% 3W Chip Resistor Nonstandard Anti-Sulfur, Automotive AEC-Q200, Current Sense, Moisture Resistant, Pulse Withstanding Metal Element; Category: Resistors  Chip Resistor - Surface Mount; Series: WSL; Part Status: Active; Composition: Metal Element; Features: Anti-Sulfur, Automotive AEC-Q200, Current Sense, Moisture Resistant, Pulse Withstanding; Operating Temperature: -65°C ~ 170°C; Package / Case: Nonstandard; Supplier Device Package: 3637; Size / Dimension: 0.360" L x 0.370" W (9.14mm x 9.40mm); Height - Seated (Max): 0.035" (0.89mm); Number of Terminations: 4; JLCPCB Part #: C4188216
R7 R10 R11 R14 R16 R18 = Res,0805,470Ω,±0.1%,±25ppm/°C,ERA-6AEB471V: RES SMD 470 OHM 0.1% 1/8W 0805; Manufacturer: Panasonic Electronic Components; Detailed Description: 470 Ohms ±0.1% 0.125W, 1/8W Chip Resistor 0805 (2012 Metric) Automotive AEC-Q200 Thin Film; Power (Watts): 0.125W, 1/8W; Features  Automotive: AEC-Q200; mfg P/N: ERA-6AEB471V; Category: Resistors  Chip Resistor - Surface Mount; Mfr: Panasonic Electronic Components; Series: ERA-6A; Part Status: Active; Composition: Thin Film; Operating Temperature: -55°C ~ 155°C; Package / Case: 0805 (2012 Metric); Supplier Device Package: 0805; Ratings: AEC-Q200; Size / Dimension: 0.079" L x 0.049" W (2.00mm x 1.25mm); Height - Seated (Max): 0.024" (0.60mm); Number of Terminations: 2; Base Product Number: ERA-6AEB; JLCPCB Part #: C473280
R13 R15 R19 R21 R27 = Res,0805,10.0kΩ,1%,100 ppm,CRCW080510K0FKTA: RES SMD 10K OHM 1% 1/8W 0805; Temperature Coefficient: 100.0 ppm/C; Lead-Free Status: Contains Lead; Voltage Rating (DC): 150.0 V; Power Rating: 0.125 W; Case/Package (SI): 2012; Size-Width: 0.00125 m; Resistance Tolerance: 1%; Size-Length: 0.002 m; RoHS: Non-Compliant; Power Dissipation: 0.125 W; Number of Pins: 2; REACH SVHC Compliance: No SVHC; Size-Height: 0.00045 m; Case/Package: 0805; Mounting Style: Surface Mount; Supplier 1: Digi-Key; Supplier Part Number 1: 541-3016-1-ND; JLCPCB Part #: C17414
R17 R22 R26 R29 = Res,0805,100K,±0.1%,±25ppm/°C,ERA-6AEB104V: RES SMD 100K OHM 0.1% 1/8W 0805; Manufacturer: Panasonic Electronic Components; Detailed Description: 100 kOhms ±0.1% 0.125W, 1/8W Chip Resistor 0805 (2012 Metric) Automotive AEC-Q200 Thin Film; Power (Watts): 0.125W, 1/8W; Features  Automotive: AEC-Q200; mfg P/N: ERA-6AEB104V; Category: Resistors  Chip Resistor - Surface Mount; Mfr: Panasonic Electronic Components; Series: ERA-6A; Part Status: Active; Composition: Thin Film; Operating Temperature: -55°C ~ 155°C; Package / Case: 0805 (2012 Metric); Supplier Device Package: 0805; Ratings: AEC-Q200; Size / Dimension: 0.079" L x 0.049" W (2.00mm x 1.25mm); Height - Seated (Max): 0.024" (0.60mm); Number of Terminations: 2; Base Product Number: ERA-6AEB; Supplier 1: Mouser; Supplier Part Number 1: 667-ERA-6AEB104V; Supplier 2: Future Electronics; Supplier Part Number 2: 3098727; Supplier 3: Digikey; Supplier Part Number 3: P100KDACT-ND; JLCPCB Part #: C192074
R28 = Res,POT,TH,10KΩ,0.5W,±10%,±100ppm/°C,CT94EW103: TRIMMER 10K OHM 0.5W PC PIN TOP; Manufacturer: Nidec Copal Electronics; Detailed Description: 10 kOhms 0.5W, 1/2W PC Pins Through Hole Trimmer Potentiometer Cermet 18 Turn Top Adjustment; Power (Watts): 0.5W, 1/2W; Tolerance: ±10%; Adjustment Type: Top Adjustment; Resistive Material: Cermet; Number of Turns: 18; mfg P/N: CT94EW103; Category: Potentiometers, Variable Resistors; Series: CT94; Part Status: Active; Temperature Coefficient: ±100ppm/°C; Mounting Type: Through Hole; Termination Style: PC Pins; Size / Dimension: Square - 0.378"" L x 0.189"" W x 0.378"" H (9.60mm x 4.80mm x 9.60mm); Supplier 1: Digi-Key; Supplier Part Number 1: CT94EW103-ND
R32 = Res,0805,1.00 kΩ,5%,200ppm,CRCW08051K00JNEA: Res Thick Film 0805 1K Ohm 5% 0.125W(1/8W) ±200ppm/C Molded SMD Automotive Paper T/R; Power Rating: 125 mW; Case/Package (SI): 2012; Lead-Free Status: Lead Free; Temperature Coefficient: 200 ppm/°C; Voltage Rating (DC): 150 V; Size-Width: 1.25 mm; Mounting Style: Surface Mount; REACH SVHC Compliance: No SVHC; Manufacturer Part Number: CRCW08051K00JNEA; Number of Pins: 2; Size-Height: 450 µm; Packaging: Tape & Reel (TR), Cut Tape (CT); RoHS: Compliant; Resistance Tolerance: ±5%; Case/Package: 0805; Size-Length: 2.00 mm; Supplier 1: Digi-Key; Supplier Part Number 1: 541-1.0KADKR-ND; Supplier 2: Digi-Key; Supplier Part Number 2: 541-1.0KACT-ND; JLCPCB Part #: C17513
Rel1 = Relay,SPST,1A,SMD,60Vdc,12Vcoil,Non Latching,G6L-1F DC12: Telecom Relay SPST-NO (1 Form A) Surface Mount; Manufacturer: Omron Electronics Inc-EMC Div; Coil Voltage: 12VDC; Contact Rating (Current): 1 A; Switching Voltage: 125VAC, 60VDC - Max; Load - Max Switching: 125VA, 60W; Coil Current: 15 mA; Seal Rating: Sealed - Fully; Must Operate Voltage: 9 VDC; Must Release Voltage: 1.2 VDC; Operate Time: 5 ms; Approval Agency: CSA, UL; Coil Resistance: 800 Ohms; Detailed Description: Telecom Relay SPST-NO (1 Form A) Surface Mount; mfg P/N: G6L-1F DC12; Series: G6L; Mounting Type: Surface Mount; Contact Form: SPST-NO (1 Form A); Coil Type: Non Latching; Termination Style: Gull Wing; Release Time: 5 ms; Operating Temperature: -40°C ~ 70°C; Relay Type: Telecom; Base Product Number: G6L-1F; Supplier 1: Allied; Supplier Part Number 1: 70175325; Supplier 2: Digikey; Supplier Part Number 2: Z1233-ND
U2 = IC,CurrentSense,Isolated,8.2 Gain,500Khz,SI8921BD-IS4R: Isolation IC Inverters, Power Supplies, UPS 8-SOIC; Mfr: Skyworks Solutions Inc.; Base Product Number: SI8921; Detailed Description: Isolation IC Inverters, Power Supplies, UPS 8-SOIC; Category: Integrated Circuits (ICs)  Linear  Amplifiers  Special Purpose Amplifiers; Part Status: Active; Type: Isolation; Applications: Automotive, Inverters, Power Supplies, UPS; Mounting Type: Surface Mount; Package / Case: 8-SOIC (0.295", 7.50mm Width); Supplier Device Package: 8-SOIC; Supplier 1: Digikey; Supplier Part Number 1: 863-SI8921BD-IS4RCT-ND; Supplier 2: Digikey; Supplier Part Number 2: 863-SI8921BD-IS4RDKR-ND; Supplier 3: Digikey; Supplier Part Number 3: 863-SI8921BD-IS4RTR-ND; Supplier 4: Mouser; Supplier Part Number 4: 634-SI8921BDIS4
U3 U8 = OPAMP, single, General Purpose,Rail-to-Rail,10MHz,SOT-23-5,OPA197IDBVT: General Purpose Amplifier 1 Circuit Rail-to-Rail SOT-23-5; Manufacturer: Texas Instruments; Supply Current: 1mA; Number of Channels: 1; Slew Rate: 20V/μs; Gain Bandwidth Product: 10MHz; Voltage - Input Offset: 25uV; Current - Output / Channel: 65mA; Current - Input Bias: 5pA; Voltage - Supply, Single/Dual (±): 4.5 V ~ 36 V, ±2.25 V ~ 18 V; REACH SVHC Compliance: No SVHC; Operating Temperature: -40°C ~ 125°C; Supplier Device Package: SOT-23-5; Supplier 1: LCSC; Supplier Part Number 1: C131929; Supplier 2: Digi-Key; Supplier Part Number 2: 296-44076-6-ND; Mfg P/N: OPA197IDBVT; Supplier 3: Mouser; Supplier Part Number 3: 595-OPA197IDBVT; Supplier 4: Mouser; Supplier Part Number 4: 595-OPA197IDBVR; JLCPCB Part #: C131929
U5 U9 = OPAMP,20Mhz,MOSFET DRIVER,SOT23-5,LM7321MF: Single Rail-to-Rail Input/Output, ±15V, High Output Current and Unlimited Capacitive Load Operational Amplifier, 5-pin SOT-23, Pb-Free; Bandwidth: 20000000.0 Hz; Input Offset Drift: 2e-06 V/K; Lead-Free Status: Lead Free; Number of Channels: 1; Output Current: 0.06 A; Slew Rate: 18.0 V/μs; Case/Package: SOIC; Gain Bandwidth Product: 20000000.0 Hz; Lifecycle Status: Active; Mounting Style: Surface Mount; Number of Pins: 5; Packaging: Tape & Reel (TR); REACH SVHC Compliance: No SVHC; RoHS: Compliant; mfg P/N: LM7321MF/NOPB; Supplier 1: Digi-Key; Supplier Part Number 1: LM7321MF/NOPBCT-ND; Supplier 2: LCSC; Supplier Part Number 2: C128614; Supplier 3: Digikey; Supplier Part Number 3: 296-LM7321MFE/NOPBTR-ND; Supplier 4: Digikey; Supplier Part Number 4: 296-LM7321QMFX/NOPBTR-ND; JLCPCB Part #: C128614

## Nets that join several sheets
+5: MelansonTech PSU_IsolatedShuntAmp Rev2 (5 pins), MelansonTech Isolated Shunt Amplifier rev 2 alt shunt (C2.2 U2.8)
+5_ISO: MelansonTech PSU_IsolatedShuntAmp Rev2 (C13.2 C14.2 L3.1 R6.2), MelansonTech Isolated Shunt Amplifier rev 2 alt shunt (C1.2 U2.1)
+12: MelansonTech PSU_IsolatedShuntAmp Rev2 (C32.2 C33.2 U1.1), MelansonTech Isolated Shunt Amplifier rev 2 alt shunt (12 pins)
GND: MelansonTech PSU_IsolatedShuntAmp Rev2 (25 pins), MelansonTech Isolated Shunt Amplifier rev 2 alt shunt (23 pins)
GND_ISO: MelansonTech PSU_IsolatedShuntAmp Rev2 (C13.1 C14.1 PSU1.7 R6.1), MelansonTech Isolated Shunt Amplifier rev 2 alt shunt (C1.1 R1.2 R5.4 U2.4)
ISenseRTN: MelansonTech PSU_IsolatedShuntAmp Rev2 (C29.1 C30.2), MelansonTech Isolated Shunt Amplifier rev 2 alt shunt (9 pins)
HighGain: MelansonTech PSU_IsolatedShuntAmp Rev2 (D1.2 SW1.4), MelansonTech Isolated Shunt Amplifier rev 2 alt shunt (5 pins)